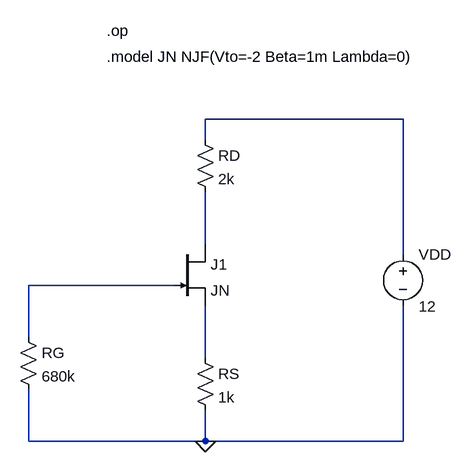
[diagram p0: schematic Ex03.asc]
Ex03.asc, the LTspice schematic file:
Version 4.1
SHEET 1 880 680
WIRE 416 -48 112 -48
WIRE 112 -16 112 -48
WIRE 112 144 112 64
WIRE 416 160 416 -48
WIRE 64 208 -160 208
WIRE -160 288 -160 208
WIRE 112 320 112 240
WIRE -160 448 -160 368
WIRE 112 448 112 400
WIRE 112 448 -160 448
WIRE 416 448 416 240
WIRE 416 448 112 448
FLAG 112 448 0
SYMBOL njf 64 144 R0
SYMATTR InstName J1
SYMATTR Value JN
SYMBOL voltage 416 144 R0
SYMATTR InstName VDD
SYMATTR Value 12
SYMBOL res -176 272 R0
SYMATTR InstName RG
SYMATTR Value 680k
SYMBOL res 96 304 R0
SYMATTR InstName RS
SYMATTR Value 1k
SYMBOL res 96 -32 R0
SYMATTR InstName RD
SYMATTR Value 2k
TEXT -40 -144 Left 2 !.model JN NJF(Vto=-2 Beta=1m Lambda=0)
TEXT -40 -184 Left 2 !.op

The netlist it stands for:
* Ex03.asc
J1 N002 N003 N004 JN
VDD N001 0 12
RG N003 0 680k
RS N004 0 1k
RD N001 N002 2k
.model NJF NJF
.model PJF PJF
.lib standard.jft
.model JN NJF(Vto=-2 Beta=1m Lambda=0)
.op
.backanno
.end